# Altium schematic sheet Power-Sheet.SchDoc (part 3 of 3)
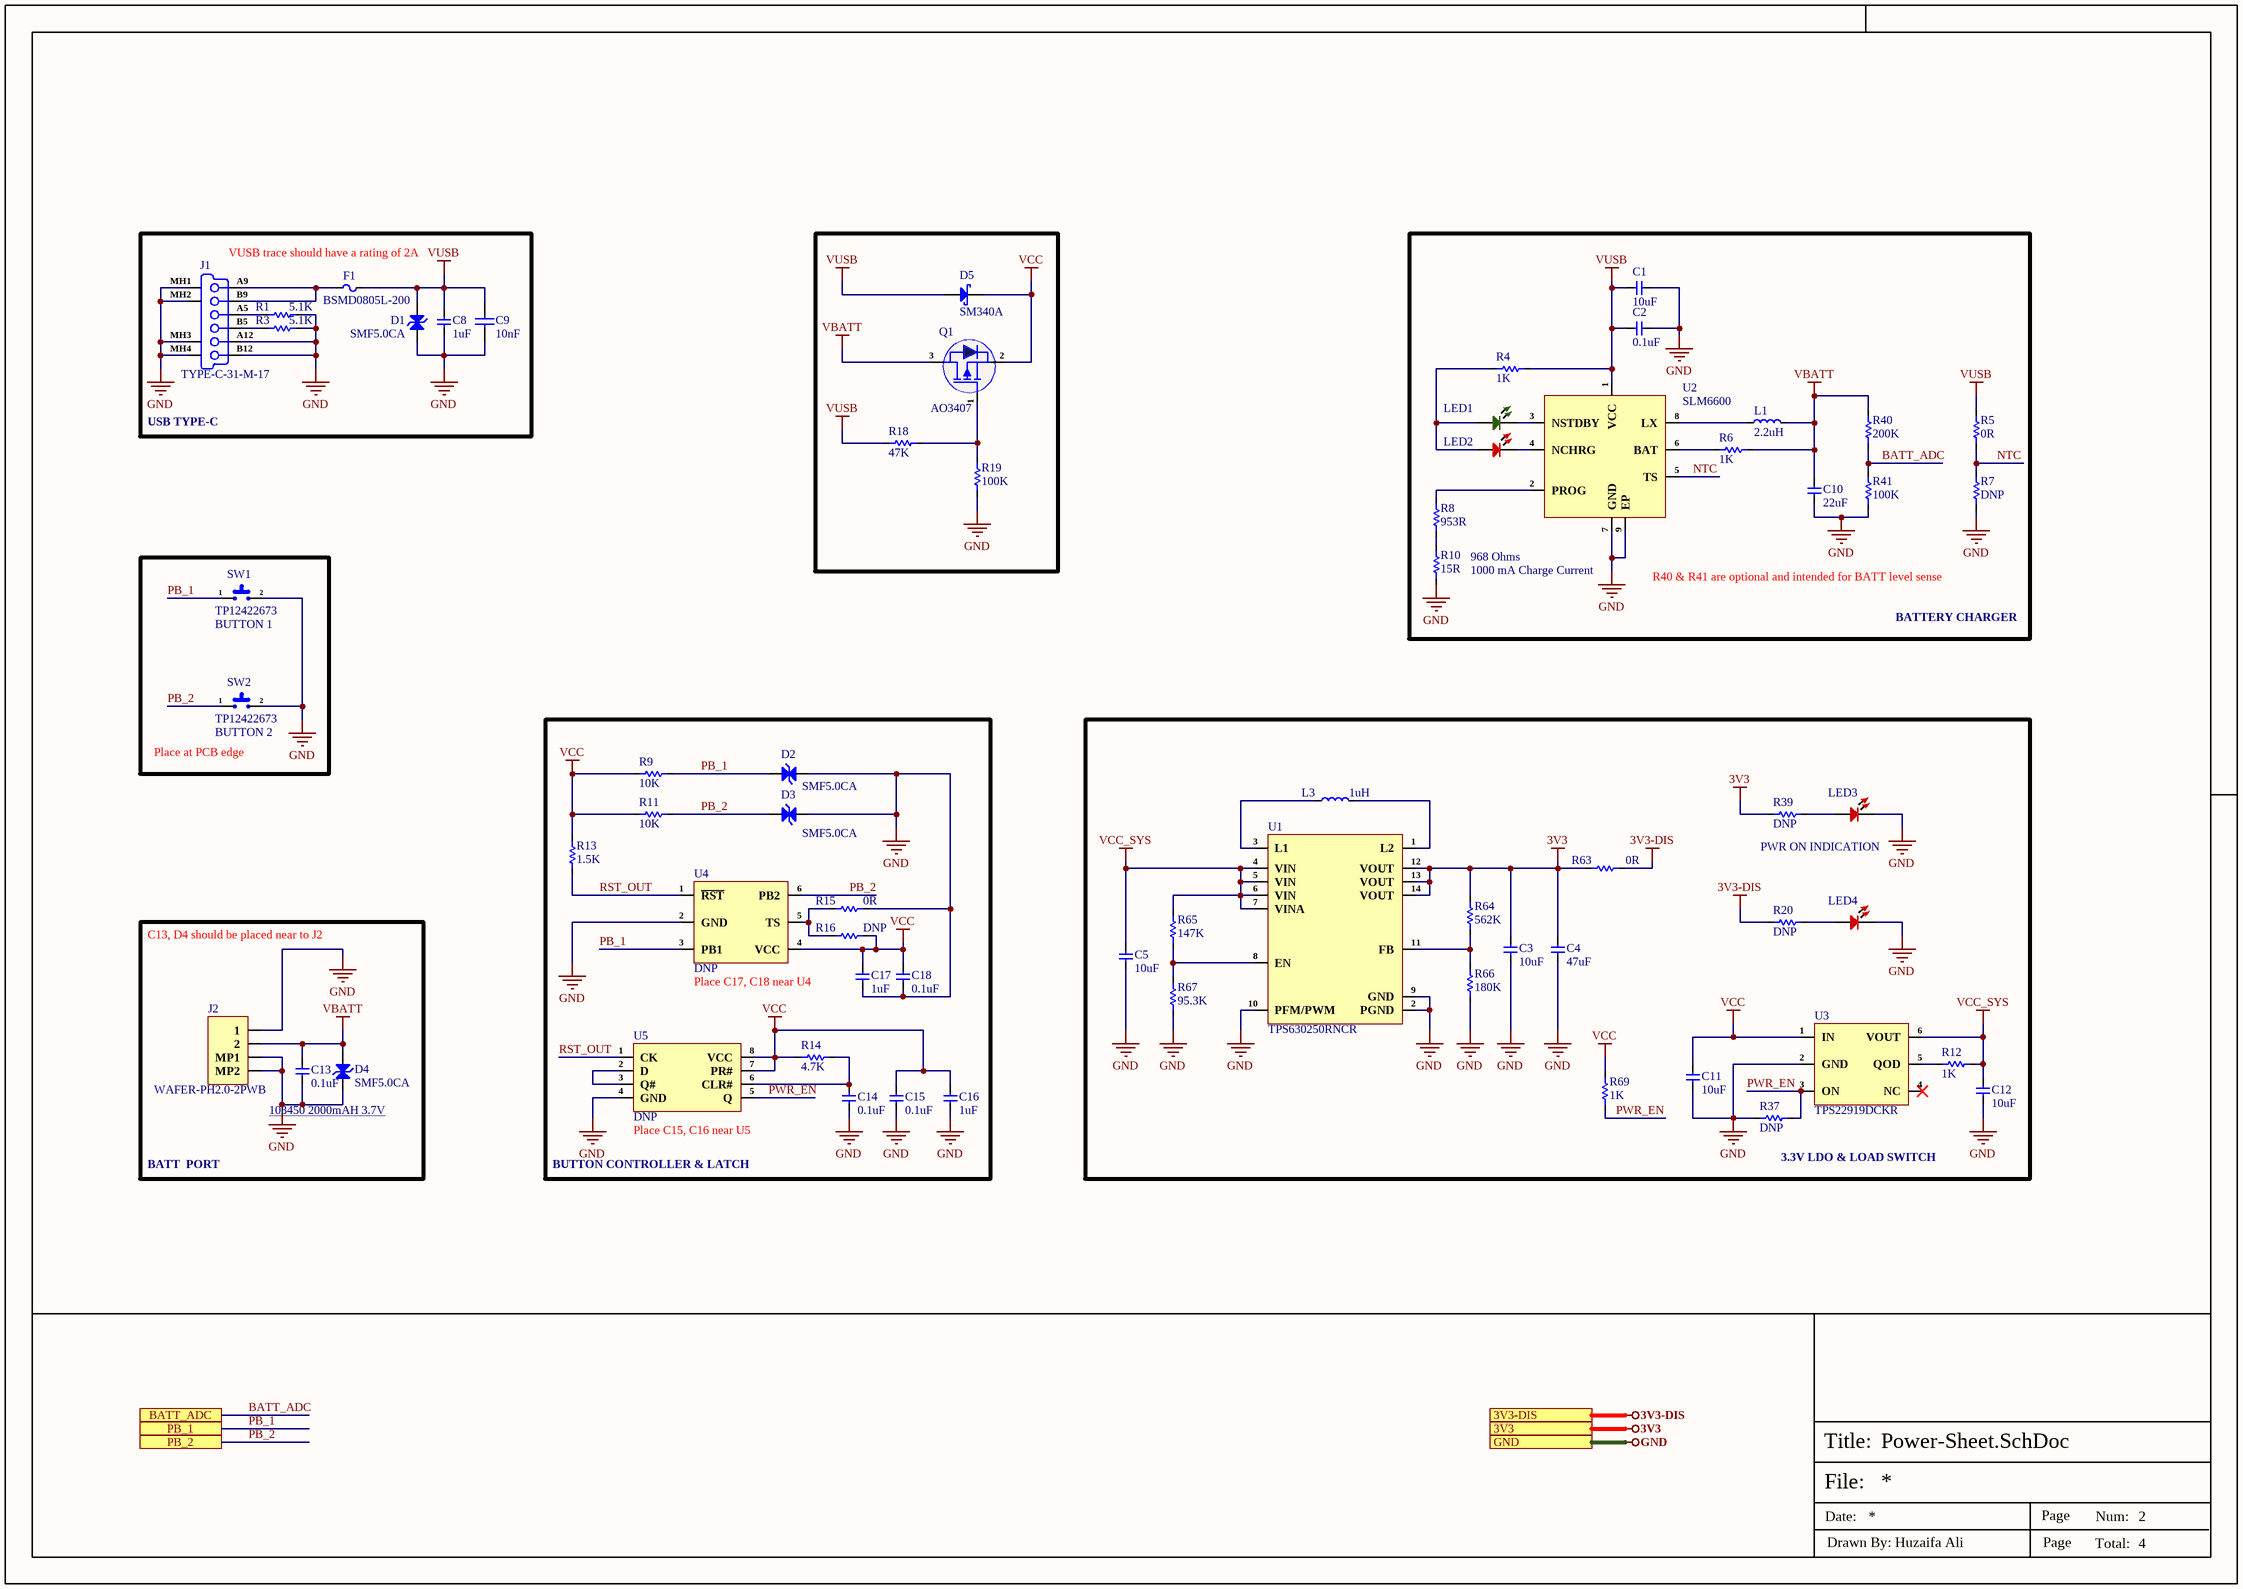
[diagram p2: Power-Sheet.SchDoc]

## Library data of the parts (continued)
U3 = TPS22919DCKR: 5.5V 1.5A 90mΩ Controlled Rise Time Self-Protecting Load Switch; Manufacturer: Texas Instruments; Item Type: IC; Fall Time: 10us; Min Supply Voltage: 1.6V; Nominal Supply Current: 8uA; Number of Drivers: 1NUMBER; Rise Time: 750us; Turn-Off Delay Time: 6us; Turn-On Delay Time: 1.5ms; Supplier: Digikey; LCSC Part Number: C2149796; Manufacturer Part Number: TPS22919DCKR; RoHS: Yes; Stock: 134665; Pricing: 1=0.18, 10=0.122, 25=0.1072, 100=0.0911, 250=0.08344, 500=0.07882, 1000=0.07503 (USD); Pins: 6NUMBER; Max Supply Voltage: 5.5V; Output Current: 1.5A; Length: 2mm; Width: 1.25mm; Height: 1.1mm; Thickness: 900um; ComponentLink1URL: http://www.ti.com/general/docs/suppproductinfo.tsp?distId=10&amp;gotoUrl=http%3A%2F%2Fwww.ti.com%2Flit%2Fgpn%2Ftps22919&src-supplier=Digikey; ComponentLink1Description: http://www.ti.com/general/docs/suppproductinfo.tsp?distId=10&amp;gotoUrl=http%3A%2F%2Fwww.ti.com%2Flit%2Fgpn%2Ftps22919&src-supplier=Digikey
U4 = TPS3421EGDRYR: IC SUPERVISOR 2 CHANNEL 6SON; Manufacturer: Texas Instruments; Supplier: Digikey; LCSC Part Number: C361167; Manufacturer Part Number: TPS3421EGDRYR; RoHS: Yes; Item Type: IC; Stock: 11931; Pricing: 1=1.12, 10=0.811, 25=0.7332, 100=0.6475, 250=0.6066, 500=0.58194, 1000=0.56164, 2500=0.5402 (USD); ComponentLink1URL: http://components.arrow.com/part/dataview/56191445S506834N7713?src-supplier=Arrow+Electronics; ComponentLink1Description: http://components.arrow.com/part/dataview/56191445S506834N7713?src-supplier=Arrow+Electronics; ComponentLink2URL: http://www.ti.com/lit/gpn/tps3421?src-supplier=Mouser; ComponentLink2Description: http://www.ti.com/lit/gpn/tps3421?src-supplier=Mouser; ComponentLink3URL: http://www.ti.com/lit/ds/symlink/tps3420.pdf?src-supplier=Digikey; ComponentLink3Description: http://www.ti.com/lit/ds/symlink/tps3420.pdf?src-supplier=Digikey; ComponentLink4URL: http://www.ti.com/general/docs/suppproductinfo.tsp?distId=10&amp;gotoUrl=http%3A%2F%2Fwww.ti.com%2Flit%2Fgpn%2Ftps3420&src-supplier=Digikey; ComponentLink4Description: http://www.ti.com/general/docs/suppproductinfo.tsp?distId=10&amp;gotoUrl=http%3A%2F%2Fwww.ti.com%2Flit%2Fgpn%2Ftps3420&src-supplier=Digikey; ComponentLink5URL: http://www.ti.com/general/docs/lit/getliterature.tsp?genericPartNumber=TPS3422&&fileType=pdf&src-supplier=Avnet; ComponentLink5Description: http://www.ti.com/general/docs/lit/getliterature.tsp?genericPartNumber=TPS3422&&fileType=pdf&src-supplier=Avnet
U5 = NC7SZ74K8X: IC FF D-TYPE SNGL 1BIT US8; Manufacturer: ON Semiconductor / Fairchild; Number of Channels: 1NUMBER; Number of Outputs: 2NUMBER; Supplier: Digikey; LCSC Part Number: C128370; Manufacturer Part Number: NC7SZ74K8X; RoHS: Yes; Item Type: IC; Stock: 98; Pricing: 1=0.71, 10=0.427, 25=0.352, 100=0.2668, 250=0.22504, 500=0.1993, 1000=0.17774 (USD); Number of Inputs: 1NUMBER; Lead Free: 5697LeadFree; ComponentLink1URL: https://datasheet.ciiva.com/34301/1022228-34301883.pdf?src-supplier=Jameco; ComponentLink1Description: https://datasheet.ciiva.com/34301/1022228-34301883.pdf?src-supplier=Jameco; ComponentLink2URL: https://datasheet.ciiva.com/15091/getdatasheetpartid-93111-15091349.pdf?src-supplier=Verical; ComponentLink2Description: https://datasheet.ciiva.com/15091/getdatasheetpartid-93111-15091349.pdf?src-supplier=Verical; ComponentLink3URL: https://datasheet.ciiva.com/5701/1727525-5701664.pdf?src-supplier=Farnell; ComponentLink3Description: https://datasheet.ciiva.com/5701/1727525-5701664.pdf?src-supplier=Farnell; ComponentLink4URL: https://datasheet.ciiva.com/8250/nc7sz74-8250464.pdf?src-supplier=Avnet; ComponentLink4Description: https://datasheet.ciiva.com/8250/nc7sz74-8250464.pdf?src-supplier=Avnet; ComponentLink5URL: https://datasheet.ciiva.com/4812/nc7sz74-116462-4812418.pdf?src-supplier=Mouser; ComponentLink5Description: https://datasheet.ciiva.com/4812/nc7sz74-116462-4812418.pdf?src-supplier=Mouser; ComponentLink6URL: https://datasheet.ciiva.com/1856/nc7sz74-1856933.pdf?src-supplier=Digikey; ComponentLink6Description: https://datasheet.ciiva.com/1856/nc7sz74-1856933.pdf?src-supplier=Digikey; ComponentLink7URL: https://datasheet.ciiva.com/1856/nc7sz74-1856934.pdf?src-supplier=Digikey; ComponentLink7Description: https://datasheet.ciiva.com/1856/nc7sz74-1856934.pdf?src-supplier=Digikey; ComponentLink8URL: https://datasheet.ciiva.com/1856/nc7sz74-1856935.pdf?src-supplier=Digikey; ComponentLink8Description: https://datasheet.ciiva.com/1856/nc7sz74-1856935.pdf?src-supplier=Digikey; ComponentLink9URL: https://datasheet.ciiva.com/28416/1727525-28416494.pdf?src-supplier=Element14; ComponentLink9Description: https://datasheet.ciiva.com/28416/1727525-28416494.pdf?src-supplier=Element14; ComponentLink10URL: https://datasheet.ciiva.com/7970/1727525-7970733.pdf?src-supplier=Element14; ComponentLink10Description: https://datasheet.ciiva.com/7970/1727525-7970733.pdf?src-supplier=Element14; ComponentLink11URL: https://datasheet.ciiva.com/7970/1727525-7970734.pdf?src-supplier=Element14; ComponentLink11Description: https://datasheet.ciiva.com/7970/1727525-7970734.pdf?src-supplier=Element14; ComponentLink12URL: https://datasheet.ciiva.com/7970/1727525-7970735.pdf?src-supplier=Element14; ComponentLink12Description: https://datasheet.ciiva.com/7970/1727525-7970735.pdf?src-supplier=Element14; ComponentLink13URL: https://datasheet.ciiva.com/16740/nc7sz74-16740983.pdf?src-supplier=Future+Electronics; ComponentLink13Description: https://datasheet.ciiva.com/16740/nc7sz74-16740983.pdf?src-supplier=Future+Electronics; ComponentLink14URL: https://datasheet.ciiva.com/48704/001253503-da-01-en-ic-d-type-pos-trg-nc7sz74k8x-vfsop-8-fsc-48704778.pdf?src-supplier=Conrad; ComponentLink14Description: https://datasheet.ciiva.com/48704/001253503-da-01-en-ic-d-type-pos-trg-nc7sz74k8x-vfsop-8-fsc-48704778.pdf?src-supplier=Conrad